# Altium schematic sheet 2_drv8316.SchDoc
size A4; SheetNumber: 2; SheetTotal: 6
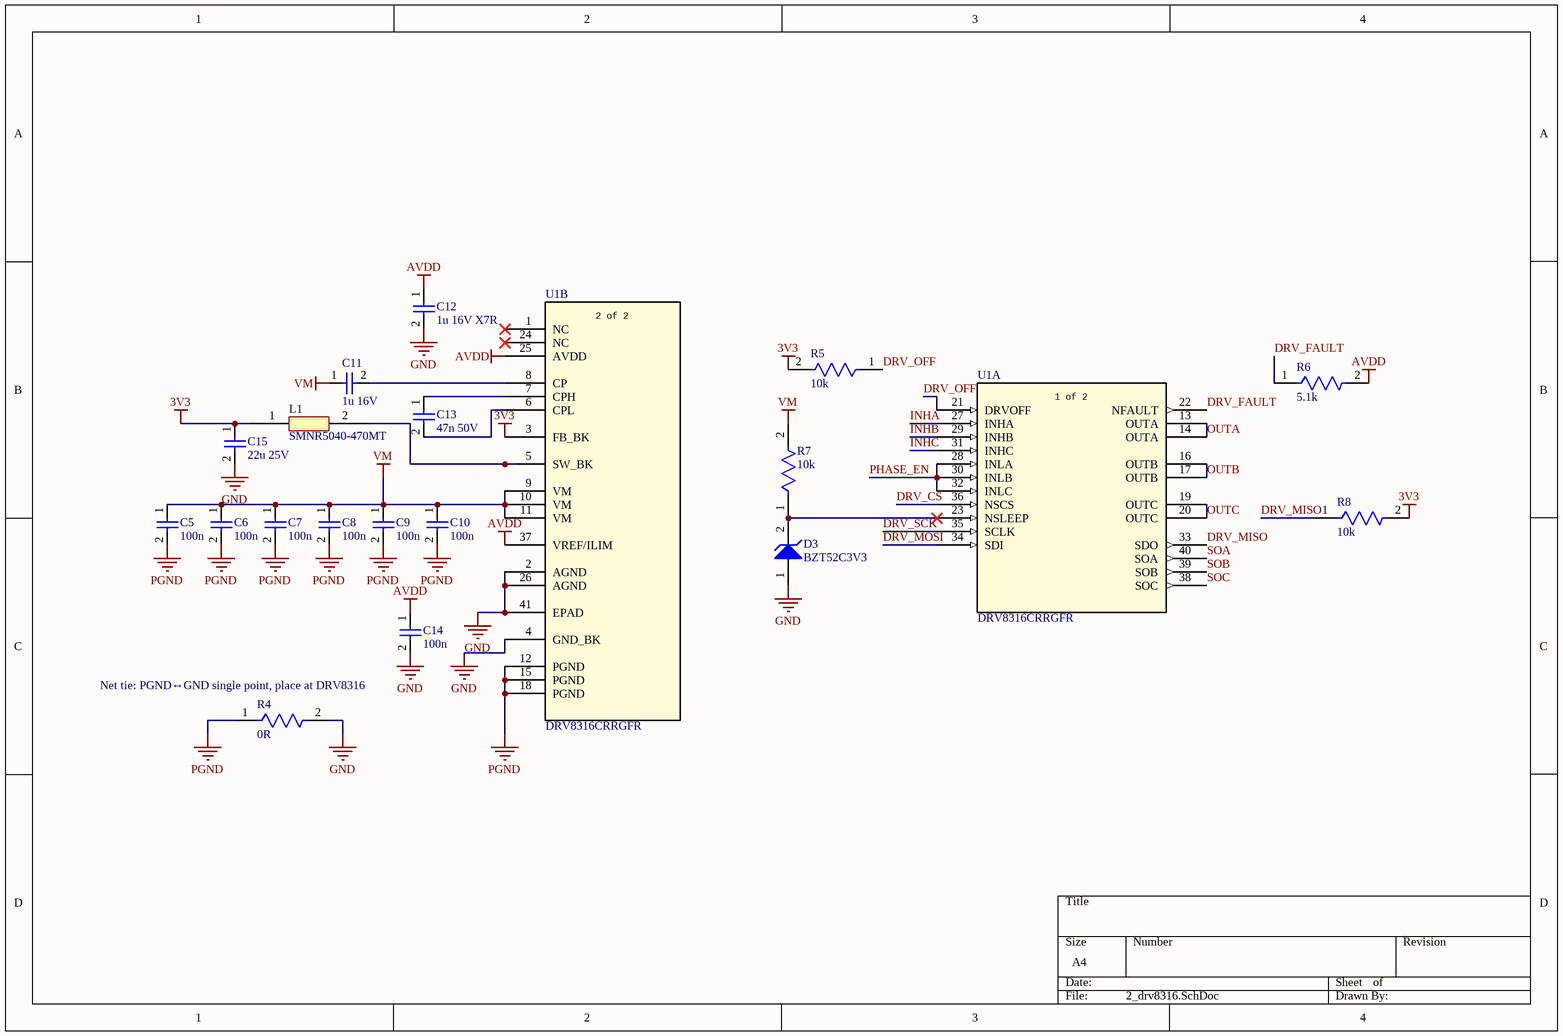
[diagram p0: 2_drv8316.SchDoc]

## Parts
C5  100n  [RES_0603]
C6  100n  [RES_0603]
C7  100n  [RES_0603]
C8  100n  [RES_0603]
C9  100n  [RES_0603]
C10  100n  [RES_0603]
C11  1u 16V  [RES_0603]
C12  1u 16V X7R  [RES_0603]
C13  47n 50V  [CAP_0402]
C14  100n  [RES_0603]
C15  22u 25V  [CAP_0805]
D3  BZT52C3V3  [SOD-123_MDD]
L1  SMNR5040-470MT  [SMNR5040]
R4  0R  [RES_0603]
R5  10k  [RES_0603]
R6  5.1k  [RES_0603]
R7  10k  [RES_0603]
R8  10k  [RES_0603]
U1  DRV8316CRRGFR  [VQFN40_RGF_TEX]  (parts A,B of 2)

## Nets
3V3: C15.1 L1.1 R5.2 R8.2 U1.3(FB_BK)
AVDD: C12.1 C14.1 R6.2 U1.25(AVDD) U1.37(VREF/ILIM)
GND: C12.2 C14.2 C15.2 D3.1(A) R4.2 U1.2(AGND) U1.4(GND_BK) U1.26(AGND) U1.41(EPAD)
PGND: C5.2 C6.2 C7.2 C8.2 C9.2 C10.2 R4.1 U1.12(PGND) U1.15(PGND) U1.18(PGND)
VM: C5.1 C6.1 C7.1 C8.1 C9.1 C10.1 C11.1 R7.2 U1.9(VM) U1.10(VM) U1.11(VM)
DRV_CS: U1.36(NSCS)
DRV_FAULT: R6.1 U1.22(NFAULT)
DRV_MISO: R8.1 U1.33(SDO)
DRV_MOSI: U1.34(SDI)
DRV_OFF: R5.1 U1.21(DRVOFF)
DRV_SCK: U1.35(SCLK)
INHA: U1.27(INHA)
INHB: U1.29(INHB)
INHC: U1.31(INHC)
OUTA: U1.13(OUTA) U1.14(OUTA)
OUTB: U1.16(OUTB) U1.17(OUTB)
OUTC: U1.19(OUTC) U1.20(OUTC)
PHASE_EN: U1.28(INLA) U1.30(INLB) U1.32(INLC)
SOA: U1.40(SOA)
SOB: U1.39(SOB)
SOC: U1.38(SOC)
NetC11_2: C11.2 U1.8(CP)
NetC13_1: C13.1 U1.7(CPH)
NetC13_2: C13.2 U1.6(CPL)
NetD3_2: D3.2(K) R7.1 U1.23(NSLEEP)
NetL1_2: L1.2 U1.5(SW_BK)

Not connected (* = marked no-connect by the designer): U1 1(NC)* 24(NC)*

## Notes on the sheet
- (near R4) Net tie: PGND↔GND single point, place at DRV8316
- (in symbol DRV8316CRRGFR, part A) 1 of 2
- (in symbol DRV8316CRRGFR, part B) 2 of 2

## Library data of the parts
C5-C12 C14 = CAP_0603: Capacitor, 0603
  C5-C10 C14: Value: 100n
  C11: Value: 1u 16V
  C12: Value: 1u 16V X7R
C13 = CAP_0402: Capacitor, 0402; MPN: CL05B473KB5VPNC; Manufacturer: Samsung Electro-Mechanics; Value: 47n 50V; LCSC: C307339
C15 = CAP_0805: Capacitor, 0805; Value: 22u 25V
D3 = BZT52C3V3: Surface Mount Zener Diode, 3.3 V, SOD-123; Manufacturer: MDD (Microdiode); LCSC: C173413
L1 = SMNR5040-470MT: 47 uH shielded power inductor, 5x5x4 mm
R4-R8 = RES_0603: Resistor, 0603
  R4: Value: 0R
  R5 R7 R8: Value: 10k
  R6: Value: 5.1k
U1 = DRV8316CRRGFR: 40-V max 8-A peak 3-phase motor driver with integrated current sensing, FETs, and enhanced CSA specs 40-VQFN -40 to 125; Manufacturer_Name: Texas Instruments; Type: Power Management; Copyright: Copyright (C) 2026 Ultra Librarian. All rights reserved.; Manufacturer_Part_Number: DRV8316CRRGFR; RefDes: RefDes